# Altium schematic sheet Top-Sheet.SchDoc
size A4; SheetNumber: 1; SheetTotal: 5
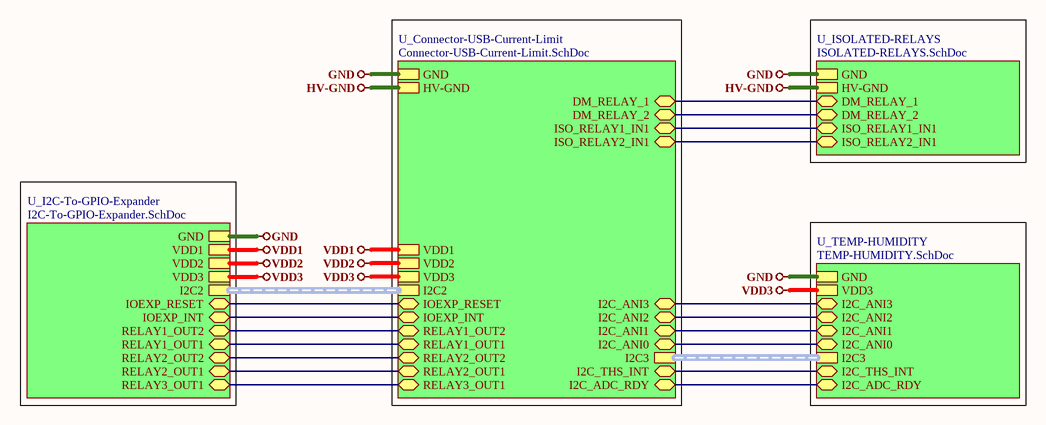
[diagram p0: Top-Sheet.SchDoc]

## Sub-sheets
U_Connector-USB-Current-Limit = Connector-USB-Current-Limit.SchDoc: DM_RELAY_1 (bidir), DM_RELAY_2 (bidir), ISO_RELAY1_IN1 (bidir), ISO_RELAY2_IN1 (bidir), GND, HV-GND, I2C_ANI3 (bidir), I2C_ANI2 (bidir), I2C_ANI1 (bidir), I2C_ANI0 (bidir), I2C3 (harness I2C3), I2C_THS_INT (bidir), I2C_ADC_RDY (bidir), VDD3, I2C2 (harness I2C2), IOEXP_RESET (bidir), IOEXP_INT (bidir), VDD1, VDD2, RELAY1_OUT2 (bidir), RELAY1_OUT1 (bidir), RELAY2_OUT2 (bidir), RELAY2_OUT1 (bidir), RELAY3_OUT1 (bidir)
U_I2C-To-GPIO-Expander = I2C-To-GPIO-Expander.SchDoc: GND, VDD3, I2C2 (harness I2C2), IOEXP_RESET (bidir), IOEXP_INT (bidir), VDD1, VDD2, RELAY1_OUT2 (bidir), RELAY1_OUT1 (bidir), RELAY2_OUT2 (bidir), RELAY2_OUT1 (bidir), RELAY3_OUT1 (bidir)
U_ISOLATED-RELAYS = ISOLATED-RELAYS.SchDoc: GND, HV-GND, DM_RELAY_1 (bidir), DM_RELAY_2 (bidir), ISO_RELAY1_IN1 (bidir), ISO_RELAY2_IN1 (bidir)
U_TEMP-HUMIDITY = TEMP-HUMIDITY.SchDoc: GND, VDD3, I2C_ANI3 (bidir), I2C_ANI2 (bidir), I2C_ANI1 (bidir), I2C_ANI0 (bidir), I2C3 (harness I2C3), I2C_THS_INT (bidir), I2C_ADC_RDY (bidir)

## Nets
GND: sheet U_Connector-USB-Current-Limit/GND, sheet U_I2C-To-GPIO-Expander/GND, sheet U_ISOLATED-RELAYS/GND, sheet U_TEMP-HUMIDITY/GND
HV-GND: sheet U_Connector-USB-Current-Limit/HV-GND, sheet U_ISOLATED-RELAYS/HV-GND
VDD1: sheet U_Connector-USB-Current-Limit/VDD1, sheet U_I2C-To-GPIO-Expander/VDD1
VDD2: sheet U_Connector-USB-Current-Limit/VDD2, sheet U_I2C-To-GPIO-Expander/VDD2
VDD3: sheet U_Connector-USB-Current-Limit/VDD3, sheet U_I2C-To-GPIO-Expander/VDD3, sheet U_TEMP-HUMIDITY/VDD3
(unnamed): sheet U_Connector-USB-Current-Limit/DM_RELAY_1, sheet U_ISOLATED-RELAYS/DM_RELAY_1
(unnamed): sheet U_Connector-USB-Current-Limit/DM_RELAY_2, sheet U_ISOLATED-RELAYS/DM_RELAY_2
(unnamed): sheet U_Connector-USB-Current-Limit/ISO_RELAY1_IN1, sheet U_ISOLATED-RELAYS/ISO_RELAY1_IN1
(unnamed): sheet U_Connector-USB-Current-Limit/ISO_RELAY2_IN1, sheet U_ISOLATED-RELAYS/ISO_RELAY2_IN1
(unnamed): sheet U_Connector-USB-Current-Limit/I2C_ANI3, sheet U_TEMP-HUMIDITY/I2C_ANI3
(unnamed): sheet U_Connector-USB-Current-Limit/I2C_ANI2, sheet U_TEMP-HUMIDITY/I2C_ANI2
(unnamed): sheet U_Connector-USB-Current-Limit/I2C_ANI1, sheet U_TEMP-HUMIDITY/I2C_ANI1
(unnamed): sheet U_Connector-USB-Current-Limit/I2C_ANI0, sheet U_TEMP-HUMIDITY/I2C_ANI0
(unnamed): sheet U_Connector-USB-Current-Limit/I2C_THS_INT, sheet U_TEMP-HUMIDITY/I2C_THS_INT
(unnamed): sheet U_Connector-USB-Current-Limit/I2C_ADC_RDY, sheet U_TEMP-HUMIDITY/I2C_ADC_RDY
(unnamed): sheet U_Connector-USB-Current-Limit/IOEXP_RESET, sheet U_I2C-To-GPIO-Expander/IOEXP_RESET
(unnamed): sheet U_Connector-USB-Current-Limit/IOEXP_INT, sheet U_I2C-To-GPIO-Expander/IOEXP_INT
(unnamed): sheet U_Connector-USB-Current-Limit/RELAY1_OUT2, sheet U_I2C-To-GPIO-Expander/RELAY1_OUT2
(unnamed): sheet U_Connector-USB-Current-Limit/RELAY1_OUT1, sheet U_I2C-To-GPIO-Expander/RELAY1_OUT1
(unnamed): sheet U_Connector-USB-Current-Limit/RELAY2_OUT2, sheet U_I2C-To-GPIO-Expander/RELAY2_OUT2
(unnamed): sheet U_Connector-USB-Current-Limit/RELAY2_OUT1, sheet U_I2C-To-GPIO-Expander/RELAY2_OUT1
(unnamed): sheet U_Connector-USB-Current-Limit/RELAY3_OUT1, sheet U_I2C-To-GPIO-Expander/RELAY3_OUT1

## Buses and harness runs
harness sheet U_Connector-USB-Current-Limit/I2C2 = sheet U_I2C-To-GPIO-Expander/I2C2
harness sheet U_Connector-USB-Current-Limit/I2C3 = sheet U_TEMP-HUMIDITY/I2C3